# Altium project Main-Controller-Board-v1.2.0.PrjPcb
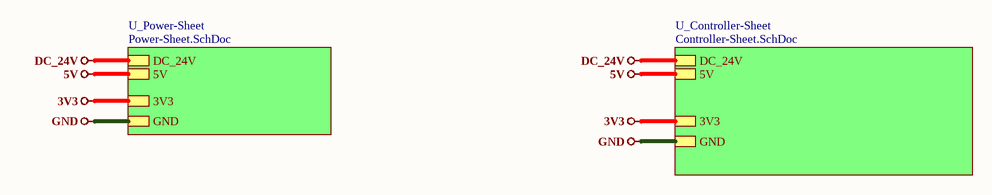
[diagram p0: Top_Sheet.SchDoc]
3 sheets, 70 parts. Net scope: hierarchical (ports join the sheet entries above them; power ports are global).
Board file: Main-Controller-Board-PCB.PcbDoc
Sheets:
  Top_Sheet.SchDoc
    U_Controller-Sheet = Controller-Sheet.SchDoc
    U_Power-Sheet = Power-Sheet.SchDoc

## Sheet Top_Sheet.SchDoc
size 420 x 297 mm; SheetNumber: 1; SheetTotal: 3

### Sub-sheets
U_Controller-Sheet = Controller-Sheet.SchDoc: 3V3, GND, 5V, DC_24V
U_Power-Sheet = Power-Sheet.SchDoc: 3V3, 5V, GND, DC_24V

### Nets
3V3: sheet U_Controller-Sheet/3V3, sheet U_Power-Sheet/3V3
5V: sheet U_Controller-Sheet/5V, sheet U_Power-Sheet/5V
DC_24V: sheet U_Controller-Sheet/DC_24V, sheet U_Power-Sheet/DC_24V
GND: sheet U_Controller-Sheet/GND, sheet U_Power-Sheet/GND

### Notes on the sheet
- File:
- Title:
- Date:
- Page
- Num:
- Total:
- Drawn By: Huzaifa Ali

## Sheet Controller-Sheet.SchDoc
size 420 x 297 mm; SheetNumber: 3; SheetTotal: 3
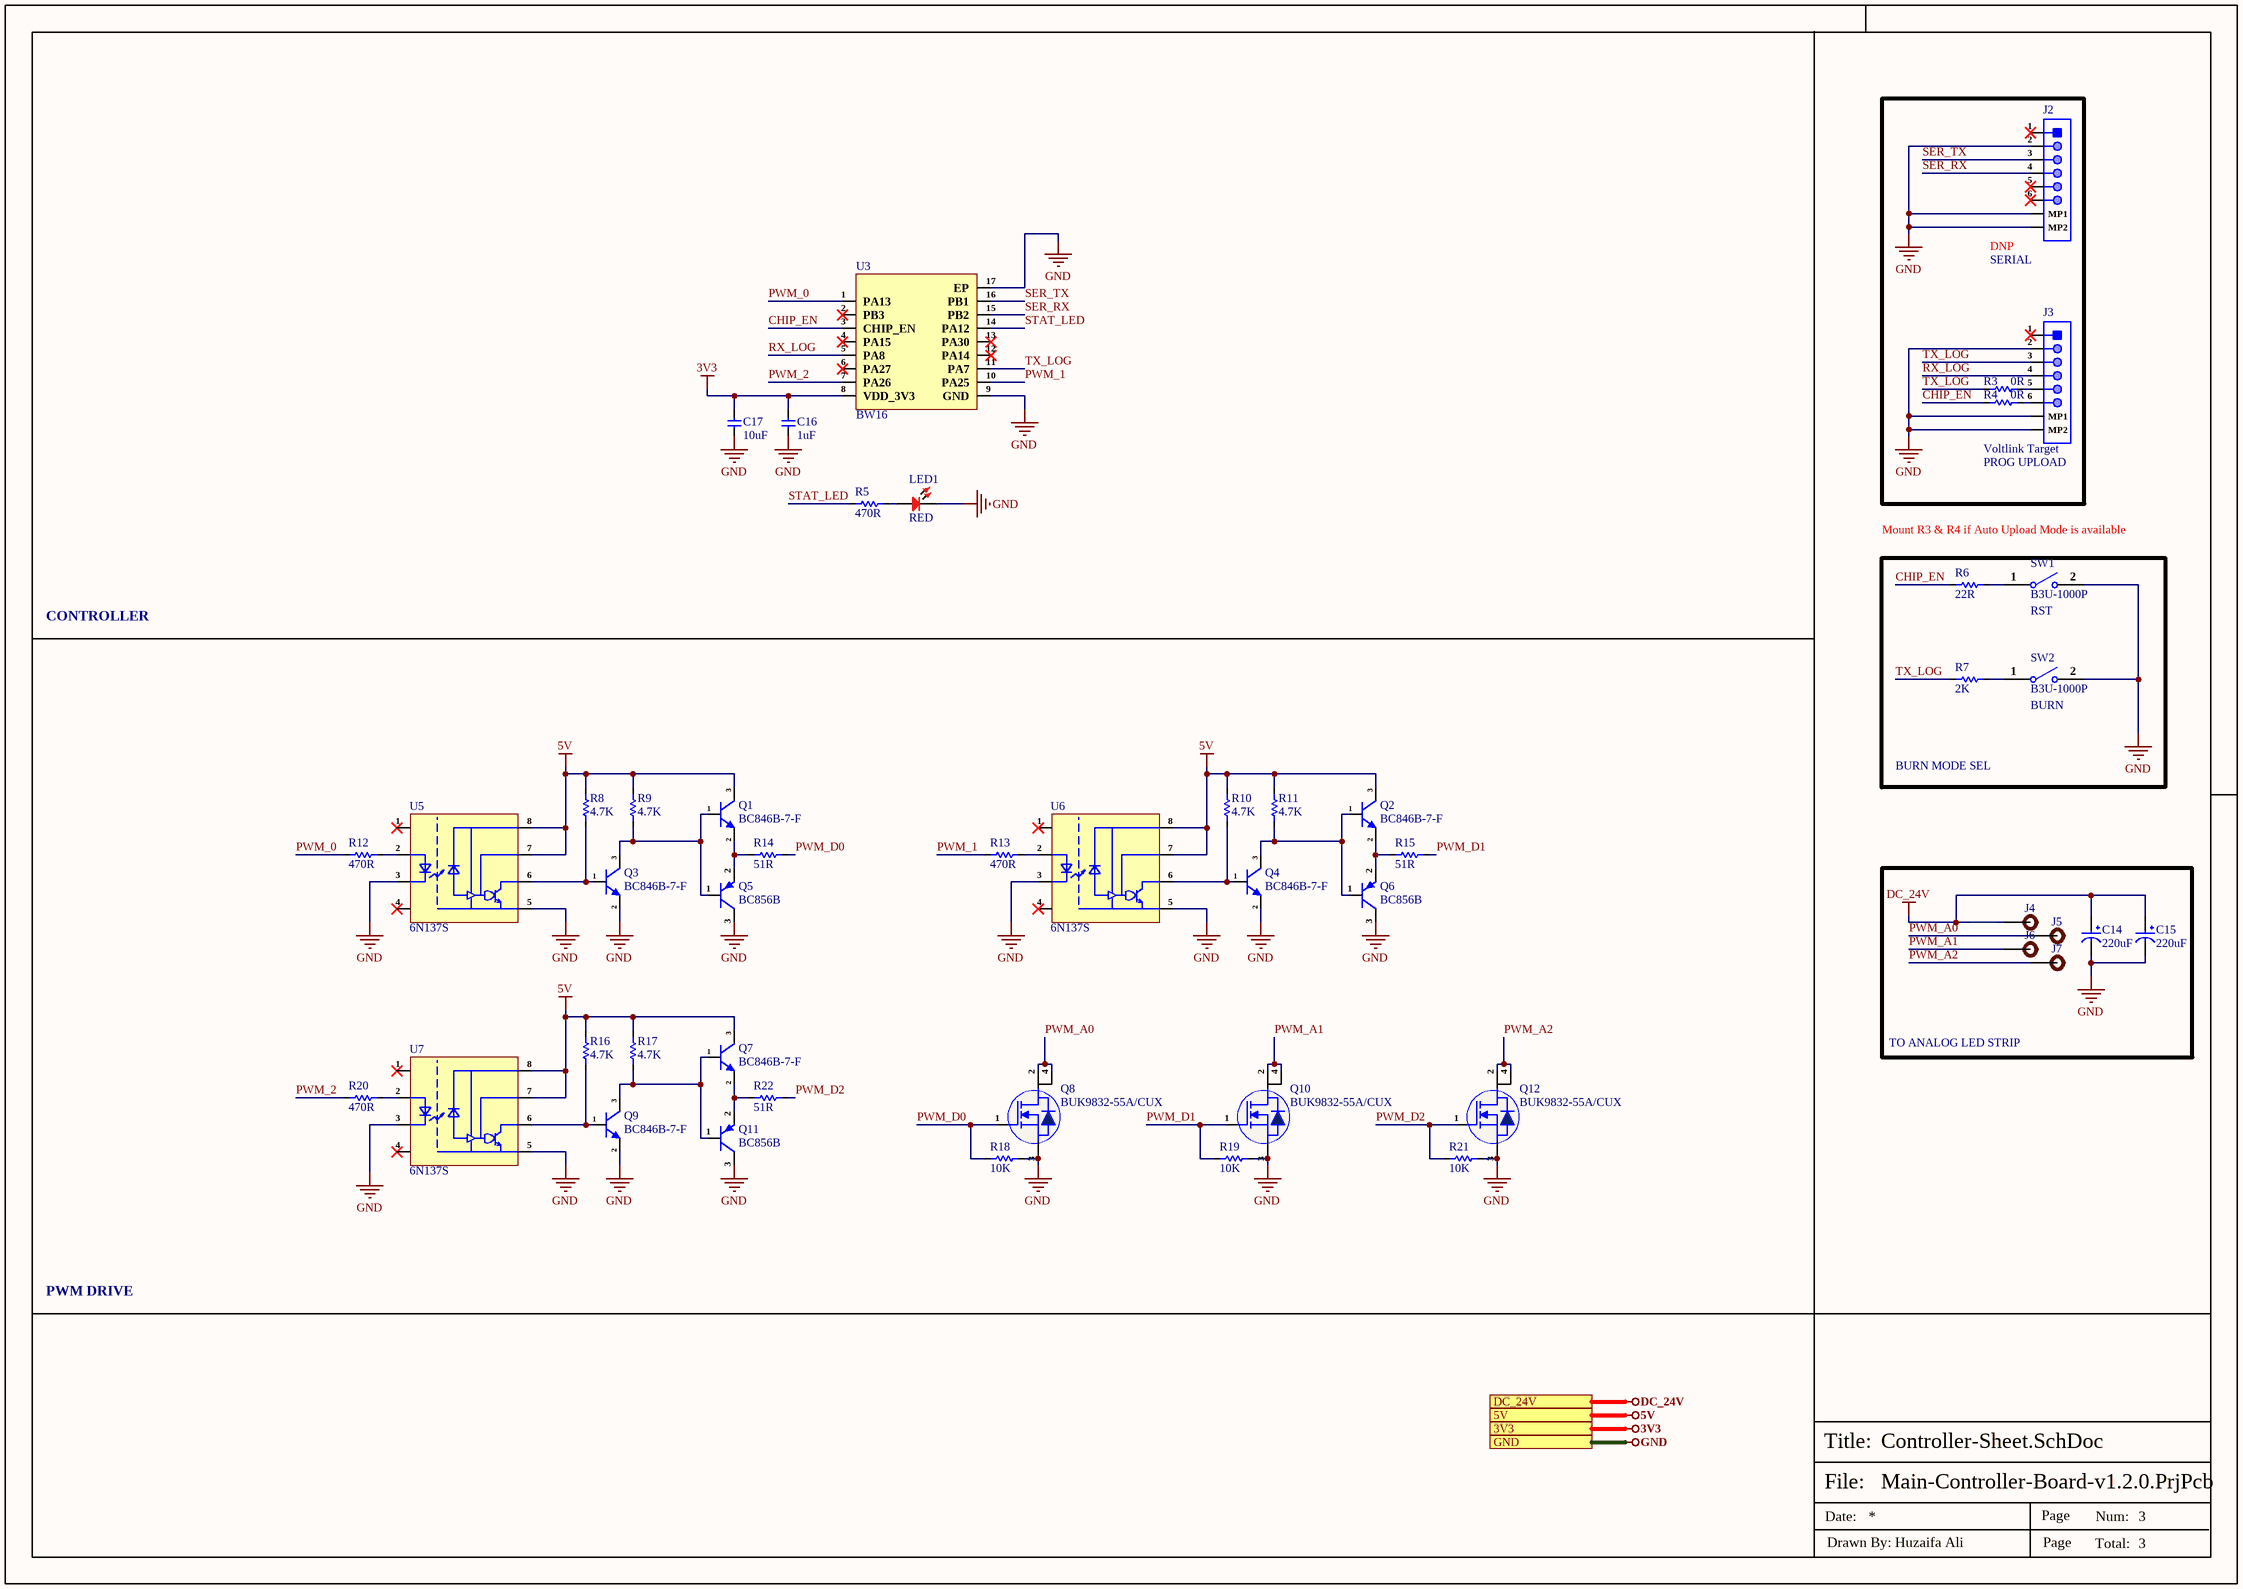
[diagram p1: Controller-Sheet.SchDoc]

### Parts
C14  220uF  [189RV0019]
C15  220uF  [189RV0019]
C16  1uF  [Cap-0402]
C17  10uF  [Cap-1210]
J2  DNP  [Voltlink Target]
J3  Voltlink Target  [Voltlink Target]
J4  Radius Pad  [Radius Pad]  (value not drawn)
J5  Radius Pad  [Radius Pad]  (value not drawn)
J6  Radius Pad  [Radius Pad]  (value not drawn)
J7  Radius Pad  [Radius Pad]  (value not drawn)
LED1  RED  [LED-0603]
Q1  BC846B-7-F  [SOT-23]
Q2  BC846B-7-F  [SOT-23]
Q3  BC846B-7-F  [SOT-23]
Q4  BC846B-7-F  [SOT-23]
Q5  BC856B  [SOT-23]
Q6  BC856B  [SOT-23]
Q7  BC846B-7-F  [SOT-23]
Q8  BUK9832-55A/CUX  [SOT- 223]
Q9  BC846B-7-F  [SOT-23]
Q10  BUK9832-55A/CUX  [SOT- 223]
Q11  BC856B  [SOT-23]
Q12  BUK9832-55A/CUX  [SOT- 223]
R3  0R  [Res-0402]
R4  0R  [Res-0402]
R5  470R  [Res-0603]
R6  22R  [Res-0402]
R7  2K  [Res-0402]
R8  4.7K  [Res-0402]
R9  4.7K  [Res-0402]
R10  4.7K  [Res-0402]
R11  4.7K  [Res-0402]
R12  470R  [Res-0603]
R13  470R  [Res-0603]
R14  51R  [RES-2512]
R15  51R  [RES-2512]
R16  4.7K  [Res-0402]
R17  4.7K  [Res-0402]
R18  10K  [Res-0402]
R19  10K  [Res-0402]
R20  470R  [Res-0603]
R21  10K  [Res-0402]
R22  51R  [RES-2512]
SW1  B3U-1000P  [B3U-1000P]
SW2  B3U-1000P  [B3U-1000P]
U3  BW16  [BW16]
U5  6N137S  [SOP-8 (S Type)]
U6  6N137S  [SOP-8 (S Type)]
U7  6N137S  [SOP-8 (S Type)]

### Blocks framed on the sheet
TO ANALOG LED STRIP: C14 C15 J4-J7

### Ports
3V3 (see Top_Sheet[4B], Power-Sheet[4D]), 5V (see Top_Sheet[4B], Power-Sheet[4D]), DC_24V (see Top_Sheet[4B], Power-Sheet[4D]), GND (see Top_Sheet[4B], Power-Sheet[4D])

### Nets
3V3: C16.2 C17.2 U3.8(VDD_3V3) ; port 3V3
5V: Q1.3(C) Q2.3(C) Q7.3(C) R8.2 R9.2 R10.2 R11.2 R16.2 R17.2 U5.7(VE) U5.8(VCC) U6.7(VE) U6.8(VCC) U7.7(VE) U7.8(VCC) ; port 5V
DC_24V: C14.1 C15.1 J4.1 ; port DC_24V
GND: C14.2 C15.2 C16.1 C17.1 J2.2 J2.MP1 J2.MP2 J3.2 J3.MP1 J3.MP2 LED1.2 Q3.2(E) Q4.2(E) Q5.3(C) Q6.3(C) Q8.3(S) Q9.2(E) Q10.3(S) Q11.3(C) Q12.3(S) R18.2 R19.2 R21.2 SW1.2 SW2.2 U3.9(GND) U3.17(EP) U5.3(C) U5.5(GND) U6.3(C) U6.5(GND) U7.3(C) U7.5(GND) ; port GND
CHIP_EN: R4.1 R6.1 U3.3(CHIP_EN)
PWM_0: R12.1 U3.1(PA13)
PWM_1: R13.1 U3.10(PA25)
PWM_2: R20.1 U3.7(PA26)
PWM_A0: J5.1 Q8.2(D) Q8.4(D)
PWM_A1: J6.1 Q10.2(D) Q10.4(D)
PWM_A2: J7.1 Q12.2(D) Q12.4(D)
PWM_D0: Q8.1(G) R14.2 R18.1
PWM_D1: Q10.1(G) R15.2 R19.1
PWM_D2: Q12.1(G) R21.1 R22.2
RX_LOG: J3.4 U3.5(PA8)
SER_RX: J2.4 U3.15(PB2)
SER_TX: J2.3 U3.16(PB1)
STAT_LED: R5.1 U3.14(PA12)
TX_LOG: J3.3 R3.1 R7.1 U3.11(PA7)
NetJ3_5: J3.5 R3.2
NetJ3_6: J3.6 R4.2
NetLED1_1: LED1.1 R5.2
NetQ1_1: Q1.1(B) Q3.3(C) Q5.1(B) R9.1
NetQ1_2: Q1.2(E) Q5.2(E) R14.1
NetQ2_1: Q2.1(B) Q4.3(C) Q6.1(B) R11.1
NetQ2_2: Q2.2(E) Q6.2(E) R15.1
NetQ3_1: Q3.1(B) R8.1 U5.6(VO)
NetQ4_1: Q4.1(B) R10.1 U6.6(VO)
NetQ7_1: Q7.1(B) Q9.3(C) Q11.1(B) R17.1
NetQ7_2: Q7.2(E) Q11.2(E) R22.1
NetQ9_1: Q9.1(B) R16.1 U7.6(VO)
NetR6_2: R6.2 SW1.1
NetR7_2: R7.2 SW2.1
NetR12_2: R12.2 U5.2(A)
NetR13_2: R13.2 U6.2(A)
NetR20_2: R20.2 U7.2(A)

Not connected (* = marked no-connect by the designer): J2 1* 5* 6*; J3 1*; U3 2(PB3)* 4(PA15)* 6(PA27)* 12(PA14)* 13(PA30)*; U5 1(NC)* 4(NC)*; U6 1(NC)* 4(NC)*; U7 1(NC)* 4(NC)*

### Notes on the sheet
- (near J2) SERIAL
- Mount R3 & R4 if Auto Upload Mode is available
- (near J3) PROG UPLOAD
- CONTROLLER
- (near SW1) RST
- (near SW2) BURN
- BURN MODE SEL
- PWM DRIVE
- File:
- Title:
- Date:
- Page
- Num:
- Total:
- Drawn By: Huzaifa Ali

### Library data of the parts
C14 C15 = 189RV0019: 220uF 35V 600mA@100KHz 160mΩ@100KHz ±20% SMD,D6.3xL7.7mm Aluminum Electrolytic Capacitors - SMD ROHS; Manufacturer: KNSCHA; Manufacturer Part Number: 189RV0019; Package: SMD,D6.3xL7.7mm; LCSC Part Number: C7471881; Item Type: Capacitors; ComponentLink1Description: LCSC; ComponentLink1URL: https://www.lcsc.com/product-detail/Aluminum-Electrolytic-Capacitors-SMD_KNSCHA-189RV0019_C7471881.html
C16 = CC0402KRX5R7BB105: CAP CER 1UF 16V X5R 0402; Manufacturer: Yageo; Tolerance: 10%; Item Type: Capacitor; Supplier 1: Digi-Key; Manufacturer Part Number: CC0402KRX5R7BB105; Stock 1: 1405667; Pricing 1: 1=0.36, 10=0.252, 100=0.1512, 500=0.1134, 1000=0.09576, 2500=0.09072, 5000=0.08568 (USD); Mount: Surface Mount; Case/Package: 0402; Weight: 2.3E-05oz; Case Code (Imperial): 0402; Case Code (Metric): 1005; Min Operating Temperature: -55°C; Max Operating Temperature: 85°C; Capacitance: 1uF; Dielectric: X5R; Packaging: Tape and Reel; Voltage Rating (DC): 16V; Voltage Rating: 16V; Termination: SMD/SMT; Composition: Ceramic; Length: 1mm; Height: 0.5mm; Width: 0.02inch; Thickness: 0.022inch; Depth: 0.5mm; Radiation Hardening: No; Lead Free: Lead Free; Halogen Free: Halogen Free; ComponentLink1URL: http://www.yageo.com/documents/recent/UPY-GPHC_X5R_4V-to-50V_12.pdf?src-supplier=Avnet+Europe; ComponentLink1Description: http://www.yageo.com/documents/recent/UPY-GPHC_X5R_4V-to-50V_12.pdf?src-supplier=Avnet+Europe; Supplier Part Number 1: 311-1691-6-ND; LCSC Part Number: C325464
C17 = C3225X7R1E106MTJ00N: CAP CER 10UF 25V X7R 1210; Manufacturer: TDK Corporation; Manufacturer Part Number: C3225X7R1E106M250AC; Item Type: Capacitors; Package: 1210; LCSC Part Number: C694198; ComponentLink1Description: LCSC; ComponentLink1URL: https://www.lcsc.com/product-detail/Multilayer-Ceramic-Capacitors-MLCC-SMD-SMT_TDK-C3225X7R1E106MTJ00N_C694198.html
J2 J3 = C145963: 1x6P SH 1 1mm 6 SMD,P=1mm Wire To Board / Wire To Wire Connector ROHS; Manufacturer: BOOMELE; Manufacturer Part Number: C145963; Package: SMD,P=1mm; LCSC Part Number: C145963; Item Type: Connector; ComponentLink1Description: LCSC; ComponentLink1URL: https://www.lcsc.com/product-detail/Wire-To-Board-Wire-To-Wire-Connector_BOOMELE-Boom-Precision-Elec-C145963_C145963.html
J4-J7 = Radius Pad: Wire Connecting pad; ComponentLink1Description: LCSC; ComponentLink1URL: *
LED1 = NCD0603R3: RED LED 0603 Light Emitting Diodes; Manufacturer: Foshan NationStar Optoelectronics; Manufacturer Part Number: NCD0603R3; Package: 0603; Item Type: LED; LCSC Part Number: C3151730; ComponentLink1Description: LCSC; ComponentLink1URL: https://www.lcsc.com/product-detail/Light-Emitting-Diodes-LED_Foshan-NationStar-Optoelectronics-NCD0603R3_C3151730.html
Q1-Q4 Q7 Q9 = BC846B-7-F: TRANS NPN 65V 0.1A SOT23-3; Manufacturer: Diodes; Item Type: Transistors; Supplier: Future Electronics; Supplier Part Number: 3888237; Manufacturer Part Number: BC846B-7-F; RoHS: Yes; Category: BJTs; Stock: 4416000; Pricing: 3000=0.0363, 12000=0.0348, 45000=0.0335, 120000=0.0325, 300000=0.0309 (USD); ComponentLink1URL: https://datasheet.ciiva.com/15139/getdatasheetpartid-139519-15139459.pdf?src-supplier=Verical; ComponentLink1Description: https://datasheet.ciiva.com/15139/getdatasheetpartid-139519-15139459.pdf?src-supplier=Verical; ComponentLink2URL: https://datasheet.ciiva.com/22711/1911717-22711685.pdf?src-supplier=Element14; ComponentLink2Description: https://datasheet.ciiva.com/22711/1911717-22711685.pdf?src-supplier=Element14; LCSC Part Number: C183643
Q5 Q6 Q11 = BC856B: 65V 200mW 220@2mA,5V 100mA PNP SOT-23 Bipolar Transistors - BJT ROHS; Manufacturer: Guangdong Hottech; Manufacturer Part Number: BC856B; Package: SOT-23; LCSC Part Number: C181144; Item Type: Transistors; ComponentLink1Description: LCSC; ComponentLink1URL: https://www.lcsc.com/product-detail/Bipolar-Transistors-BJT_Guangdong-Hottech-BC856B_C181144.html
Q8 Q10 Q12 = BUK9832-55A/CUX: MOSFET N-CH 55V 12A SOT223; Manufacturer: Nexperia; Item Type: MOSFETs; Input Capacitance: 1.594nF; Max Power Dissipation: 8W; Rds On Max: 29mR; Fall Time: 68ns; Gate to Source Voltage (Vgs): 10V; Rise Time: 125ns; Turn-Off Delay Time: 64ns; Turn-On Delay Time: 14ns; Supplier: Future Electronics; LCSC Part Number: C458151; Manufacturer Part Number: BUK9832-55A/CUX; RoHS: Yes; Stock: 59000; Pricing: 1000=0.305, 2000=0.295, 4000=0.29, 5000=0.29, 15000=0.275 (USD); Case/Package: 73Case; Pins: 4NUMBER; Contact Plating: 154ConductorMaterial; Min Operating Temperature: -55°C; Max Operating Temperature: 150°C; Packaging: 10Packaging; Continuous Drain Current (ID): 12A; Drain to Source Voltage (Vdss): 55V; Max Dual Supply Voltage: 55V; ComponentLink1URL: https://www.mouser.com/ds/2/302/BUK9832-55A-196161.pdf?src-supplier=Mouser; ComponentLink1Description: https://www.mouser.com/ds/2/302/BUK9832-55A-196161.pdf?src-supplier=Mouser; ComponentLink2URL: http://datasheet.octopart.com/BUK9832-55A-CUX-Nexperia-datasheet-87843131.pdf?src-supplier=Newark; ComponentLink2Description: http://datasheet.octopart.com/BUK9832-55A-CUX-Nexperia-datasheet-87843131.pdf?src-supplier=Newark; ComponentLink3URL: http://datasheet.octopart.com/BUK9832-55A-CUX-Nexperia-datasheet-87843131.pdf?src-supplier=Avnet; ComponentLink3Description: http://datasheet.octopart.com/BUK9832-55A-CUX-Nexperia-datasheet-87843131.pdf?src-supplier=Avnet; ComponentLink4URL: http://datasheet.octopart.com/BUK9832-55A-CUX-Nexperia-datasheet-87843131.pdf?src-supplier=Farnell; ComponentLink4Description: http://datasheet.octopart.com/BUK9832-55A-CUX-Nexperia-datasheet-87843131.pdf?src-supplier=Farnell; ComponentLink5URL: http://datasheet.octopart.com/BUK9832-55A-CUX-Nexperia-datasheet-87843131.pdf?src-supplier=Digikey; ComponentLink5Description: http://datasheet.octopart.com/BUK9832-55A-CUX-Nexperia-datasheet-87843131.pdf?src-supplier=Digikey; ComponentLink6URL: https://assets.nexperia.com/documents/data-sheet/BUK9832-55A.pdf?src-supplier=Digikey; ComponentLink6Description: https://assets.nexperia.com/documents/data-sheet/BUK9832-55A.pdf?src-supplier=Digikey; ComponentLink7URL: https://datasheet.octopart.com/BUK9832-55A-CUX-Nexperia-datasheet-87843131.pdf?src-supplier=Future+Electronics; ComponentLink7Description: https://datasheet.octopart.com/BUK9832-55A-CUX-Nexperia-datasheet-87843131.pdf?src-supplier=Future+Electronics; ComponentLink8URL: http://datasheet.octopart.com/BUK9832-55A-CUX-Nexperia-datasheet-87843131.pdf?src-supplier=TME; ComponentLink8Description: http://datasheet.octopart.com/BUK9832-55A-CUX-Nexperia-datasheet-87843131.pdf?src-supplier=TME; ComponentLink9URL: http://datasheet.octopart.com/BUK9832-55A-CUX-Nexperia-datasheet-87843131.pdf?src-supplier=Quest; ComponentLink9Description: http://datasheet.octopart.com/BUK9832-55A-CUX-Nexperia-datasheet-87843131.pdf?src-supplier=Quest; ComponentLink10URL: http://datasheet.octopart.com/BUK9832-55A-CUX-Nexperia-datasheet-87843131.pdf?src-supplier=TTI; ComponentLink10Description: http://datasheet.octopart.com/BUK9832-55A-CUX-Nexperia-datasheet-87843131.pdf?src-supplier=TTI
R3 R4 = RC0402FR-070RL: RES 0 OHM JUMPER 1/16W 0402; Manufacturer: Yageo; Item Type: Resistors; Tolerance: 1%; Power Rating: 62.5mW; Voltage Rating: 50V; Temperature Coefficient: 200ppm/°C; Max Power Dissipation: 63mW; Supplier 1: Mouser; Manufacturer Part Number: RC0402FR-070RL; RoHS: Yes; Stock 1: 8556842; Pricing 1: 1=0.10000, 10=0.01400, 50=0.01400, 100=0.00600, 1000=0.00300, 5000=0.00200, 10000=0.00100 (USD); Mount: Surface Mount; Case/Package: 0402; Contact Plating: Tin,Matte; Case Code (Imperial): 0402; Case Code (Metric): 1005; Size Code: 0402; Min Operating Temperature: -55°C; Max Operating Temperature: 155°C; Resistance: 0R; Resistor Type: Thick Film; Packaging: Tape and Reel; Termination: SMD/SMT; Features: Moisture Resistant; Series: RC; Number of Terminations: 2; Length: 1mm; Width: 0.5mm; Height: 0.35mm; Radiation Hardening: No; Lead Free: Lead Free; RoHS Compliant: Yes; ComponentLink1URL: https://datasheet.ciiva.com/8896/pyu-rc0402-51-rohs-l-6-8896149.pdf?src-supplier=Avnet; ComponentLink1Description: https://datasheet.ciiva.com/8896/pyu-rc0402-51-rohs-l-6-8896149.pdf?src-supplier=Avnet; ComponentLink2URL: https://datasheet.ciiva.com/16790/pyu-rc0402-51-rohs-l-6-r-16790444.pdf?src-supplier=Future+Electronics; ComponentLink2Description: https://datasheet.ciiva.com/16790/pyu-rc0402-51-rohs-l-6-r-16790444.pdf?src-supplier=Future+Electronics; Supplier Part Number 1: 603-RC0402FR-070RL; LCSC Part Number: C106231
R5 R12 R13 R20 = RC0603FR-07470RL: RES 470 OHM 1% 1/10W 0603; Manufacturer: Yageo; Power Rating: 100mW; Voltage Rating: 50V; Temperature Coefficient: 100ppm/°C; Working Voltage: 75V; Supplier 1: Digi-Key; Manufacturer Part Number: RC0603FR-07470RL; RoHS: Yes; Category: Chip SMD Resistors; Stock 1: 154083; Pricing 1: 1=0.10000, 10=0.02400, 100=0.00970, 1000=0.00436, 2500=0.00378 (USD); Case/Package: 0603; Case Code (Metric): 1608; Case Code (Imperial): 0603; Min Operating Temperature: -55°C; Max Operating Temperature: 155°C; Tolerance: 1%; Resistance: 470R; Packaging: Tape and Reel; Package Quantity: 1; Resistor Type: Thick Film; Number of Terminations: 2; Termination: SMD/SMT; Max Power Dissipation: 100mW; Features: Moisture Resistant; Series: RC; Technology: THICK FILM; Resistance Tolerance: 1%; Construction: Rectangular; Length: 1.6mm; Width: 0.031inch; Height: 0.022inch; Depth: 0.8mm; RoHS Compliant: Yes; REACH SVHC: No SVHC; Military Standard: Not; Lead Free: Lead Free; ComponentLink1URL: https://datasheet.ciiva.com/11808/0900766b80f96399-11808177.pdf?src-supplier=RSComponents; ComponentLink1Description: https://datasheet.ciiva.com/11808/0900766b80f96399-11808177.pdf?src-supplier=RSComponents; ComponentLink2URL: https://datasheet.ciiva.com/7746/1738695-7746359.pdf?src-supplier=Element14; ComponentLink2Description: https://datasheet.ciiva.com/7746/1738695-7746359.pdf?src-supplier=Element14; ComponentLink3URL: https://datasheet.ciiva.com/7746/1738695-7746360.pdf?src-supplier=Element14; ComponentLink3Description: https://datasheet.ciiva.com/7746/1738695-7746360.pdf?src-supplier=Element14; ComponentLink4URL: https://datasheet.ciiva.com/7660/1868787-7660793.pdf?src-supplier=Element14; ComponentLink4Description: https://datasheet.ciiva.com/7660/1868787-7660793.pdf?src-supplier=Element14; ComponentLink5URL: https://datasheet.ciiva.com/46440/1868787-46440907.pdf?src-supplier=Element14; ComponentLink5Description: https://datasheet.ciiva.com/46440/1868787-46440907.pdf?src-supplier=Element14; ComponentLink6URL: https://datasheet.ciiva.com/2454/pyu-r-int-thick-7-2454012.pdf?src-supplier=Digi-Key; ComponentLink6Description: https://datasheet.ciiva.com/2454/pyu-r-int-thick-7-2454012.pdf?src-supplier=Digi-Key; ComponentLink7URL: https://datasheet.ciiva.com/2454/pyu-r-int-thick-7-2454013.pdf?src-supplier=Digi-Key; ComponentLink7Description: https://datasheet.ciiva.com/2454/pyu-r-int-thick-7-2454013.pdf?src-supplier=Digi-Key; ComponentLink8URL: https://datasheet.ciiva.com/2454/pyu-r-int-thick-7-2454014.pdf?src-supplier=Digi-Key; ComponentLink8Description: https://datasheet.ciiva.com/2454/pyu-r-int-thick-7-2454014.pdf?src-supplier=Digi-Key; Supplier Part Number 1: 311-470HRCT-ND; LCSC Part Number: C114669
R6 = RC0402FR-0722RL: RES 22 OHM 1% 1/16W 0402; Manufacturer: Yageo; Voltage Rating: 50V; Power Rating: 62.5mW; Temperature Coefficient: 100ppm/°C; Max Power Dissipation: 63mW; Item Type: Resistor; Supplier 1: Avnet; Manufacturer Part Number: RC0402FR-0722RL; RoHS: Yes; Category: Chip SMD Resistors; Stock 1: 1810000; Pricing 1: 10000=0.00085 (USD); Case/Package: 0402; Number of Pins: 2; Case Code (Imperial): 0402; Case Code (Metric): 1005; Size Code: 0402; Min Operating Temperature: -55°C; Max Operating Temperature: 155°C; Resistor Type: Thick Film; Voltage Rating (DC): 50V; Resistance: 22R; Tolerance: 1%; Packaging: Tape and Reel; Termination: SMD/SMT; Features: Moisture Resistant; Series: RC; Number of Terminations: 2; Resistance Tolerance: 1%; Technology: THICK FILM; Construction: Rectangular; Length: 1mm; Width: 0.5mm; Height: 0.32mm; Depth: 0.5mm; RoHS Compliant: Yes; Reach SVHC Compliant: Yes; Military Standard: Not; Lead Free: Lead Free; ComponentLink1URL: https://datasheet.ciiva.com/11819/0900766b80c66297-11819462.pdf?src-supplier=RSComponents; ComponentLink1Description: https://datasheet.ciiva.com/11819/0900766b80c66297-11819462.pdf?src-supplier=RSComponents; ComponentLink2URL: https://datasheet.ciiva.com/7849/1018594-7849912.pdf?src-supplier=Element14; ComponentLink2Description: https://datasheet.ciiva.com/7849/1018594-7849912.pdf?src-supplier=Element14; ComponentLink3URL: https://datasheet.ciiva.com/7849/1018594-7849911.pdf?src-supplier=Element14; ComponentLink3Description: https://datasheet.ciiva.com/7849/1018594-7849911.pdf?src-supplier=Element14; ComponentLink4URL: https://datasheet.ciiva.com/16930/pyu-rc0402-51-rohs-l-6-r-16930687.pdf?src-supplier=Future+Electronics; ComponentLink4Description: https://datasheet.ciiva.com/16930/pyu-rc0402-51-rohs-l-6-r-16930687.pdf?src-supplier=Future+Electronics; ComponentLink5URL: https://datasheet.ciiva.com/26829/getdatasheetpartid-554995-26829991.pdf?src-supplier=Verical; ComponentLink5Description: https://datasheet.ciiva.com/26829/getdatasheetpartid-554995-26829991.pdf?src-supplier=Verical; Supplier Part Number 1: RC0402FR-0722RL; LCSC Part Number: C114765
R7 = RC0402FR-072KL: RES 2K OHM 1% 1/16W 0402; Manufacturer: Yageo; Item Type: Resistor; Value: 2kR; Power Rating: 63mW; Voltage Rating: 50V; Temperature Coefficient: 100ppm/°C; LCSC Part Number: C60488; ComponentLink2URL: https://datasheet.ciiva.com/11808/0900766b80c66297-11808787.pdf?src-supplier=Rs; ComponentLink2Description: https://datasheet.ciiva.com/11808/0900766b80c66297-11808787.pdf?src-supplier=Rs; ComponentLink3URL: https://datasheet.ciiva.com/7849/1018594-7849934.pdf?src-supplier=Element14; ComponentLink3Description: https://datasheet.ciiva.com/7849/1018594-7849934.pdf?src-supplier=Element14; ComponentLink4URL: https://datasheet.ciiva.com/7849/1018594-7849935.pdf?src-supplier=Element14; ComponentLink4Description: https://datasheet.ciiva.com/7849/1018594-7849935.pdf?src-supplier=Element14; ComponentLink5URL: https://datasheet.ciiva.com/7983/1018594-7983517.pdf?src-supplier=Element14; ComponentLink5Description: https://datasheet.ciiva.com/7983/1018594-7983517.pdf?src-supplier=Element14; ComponentLink6URL: https://datasheet.ciiva.com/2453/pyu-r-int-thick-7-2453635.pdf?src-supplier=Digi-Key; ComponentLink6Description: https://datasheet.ciiva.com/2453/pyu-r-int-thick-7-2453635.pdf?src-supplier=Digi-Key; ComponentLink7URL: https://datasheet.ciiva.com/2453/pyu-r-int-thick-7-2453636.pdf?src-supplier=Digi-Key; ComponentLink7Description: https://datasheet.ciiva.com/2453/pyu-r-int-thick-7-2453636.pdf?src-supplier=Digi-Key; ComponentLink8URL: https://datasheet.ciiva.com/2453/pyu-r-int-thick-7-2453634.pdf?src-supplier=Digi-Key; ComponentLink8Description: https://datasheet.ciiva.com/2453/pyu-r-int-thick-7-2453634.pdf?src-supplier=Digi-Key; ComponentLink9URL: https://datasheet.ciiva.com/12667/pyu-rc0402-51-rohs-l-6-r-12667451.pdf?src-supplier=Mouser; ComponentLink9Description: https://datasheet.ciiva.com/12667/pyu-rc0402-51-rohs-l-6-r-12667451.pdf?src-supplier=Mouser; ComponentLink10URL: https://datasheet.ciiva.com/15189/getdatasheetpartid-358921-15189414.pdf?src-supplier=Verical; ComponentLink10Description: https://datasheet.ciiva.com/15189/getdatasheetpartid-358921-15189414.pdf?src-supplier=Verical; Supplier: Future Electronics; Supplier Part Number: 7970452; Manufacturer Part Number: RC0402FR-072KL; RoHS: Yes; Category: Chip SMD Resistors; Stock: 8530000; Pricing: 10000=0.0018, 100000=0.0011, 200000=0.0017, 300000=0.001, 750000=0.0016, 2000000=0.0009, 2500000=0.0016, 10000000=0.0014 (USD); Case/Package: 0402; Case Code (Metric): 1005; Case Code (Imperial): 0402; Min Operating Temperature: -55°C; Max Operating Temperature: 155°C; Resistor Type: Thick Film; Tolerance: 1%; Package Quantity: 1; Packaging: Tape and Reel; Number of Terminations: 2; Termination: SMD/SMT; Max Power Dissipation: 63mW; Working Voltage: 50V; Features: Moisture Resistant; Series: RC; Technology: THICK FILM; Construction: Rectangular; Resistance Tolerance: 1%; Voltage Rating (DC): 50V; Length: 0.039inch; Width: 0.02inch; Height: 0.016inch; Depth: 0.5mm; RoHS Compliant: Yes; Military Standard: Not; Reach SVHC Compliant: Unknown; Lead Free: 5697LeadFree; ComponentLink1URL: https://datasheet.ciiva.com/11808/0900766b80c66297-11808787.pdf?src-supplier=Rs; ComponentLink1Description: https://datasheet.ciiva.com/11808/0900766b80c66297-11808787.pdf?src-supplier=Rs; ComponentLink11URL: https://datasheet.ciiva.com/2453/pyu-r-int-thick-7-2453635.pdf?src-supplier=Digikey; ComponentLink11Description: https://datasheet.ciiva.com/2453/pyu-r-int-thick-7-2453635.pdf?src-supplier=Digikey; ComponentLink12URL: https://datasheet.ciiva.com/2453/pyu-r-int-thick-7-2453636.pdf?src-supplier=Digikey; ComponentLink12Description: https://datasheet.ciiva.com/2453/pyu-r-int-thick-7-2453636.pdf?src-supplier=Digikey; ComponentLink13URL: https://datasheet.ciiva.com/2453/pyu-r-int-thick-7-2453634.pdf?src-supplier=Digikey; ComponentLink13Description: https://datasheet.ciiva.com/2453/pyu-r-int-thick-7-2453634.pdf?src-supplier=Digikey
R8-R11 R16 R17 = RC0402FR-074K7L: RES 4.7K OHM 1% 1/16W 0402; Manufacturer: Yageo; Voltage Rating (DC): 50V; Power Rating: 62.5mW; Resistance: 4.7kR; Temperature Coefficient: 100ppm/°C; Max Power Dissipation: 63mW; Item Type: Resistor; Supplier 1: Avnet; Manufacturer Part Number: RC0402FR-074K7L; RoHS: Yes; Category: Chip SMD Resistors; Stock 1: 2420000; Pricing 1: 10000=0.00085 (USD); Case/Package: 0402; Number of Pins: 2; Case Code (Imperial): 0402; Case Code (Metric): 1005; Size Code: 0402; Min Operating Temperature: -55°C; Max Operating Temperature: 155°C; Tolerance: 1%; Voltage Rating: 50V; Packaging: Tape and Reel; Resistor Type: Thick Film; Termination: SMD/SMT; Features: Moisture Resistant; Series: RC; Number of Terminations: 2; Resistance Tolerance: 1%; Construction: Rectangular; Length: 1mm; Width: 0.5mm; Height: 0.32mm; Depth: 0.5mm; Height - Seated (Max): 0.016inch; RoHS Compliant: Yes; Reach SVHC Compliant: Yes; Military Standard: Not; Lead Free: Lead Free; ComponentLink1URL: https://datasheet.ciiva.com/22661/1686128-22661342.pdf?src-supplier=Element14; ComponentLink1Description: https://datasheet.ciiva.com/22661/1686128-22661342.pdf?src-supplier=Element14; ComponentLink2URL: https://datasheet.ciiva.com/7850/1018594-7850022.pdf?src-supplier=Element14; ComponentLink2Description: https://datasheet.ciiva.com/7850/1018594-7850022.pdf?src-supplier=Element14; ComponentLink3URL: https://datasheet.ciiva.com/7850/1018594-7850023.pdf?src-supplier=Element14; ComponentLink3Description: https://datasheet.ciiva.com/7850/1018594-7850023.pdf?src-supplier=Element14; ComponentLink4URL: https://datasheet.ciiva.com/15215/getdatasheetpartid-328119-15215035.pdf?src-supplier=Verical; ComponentLink4Description: https://datasheet.ciiva.com/15215/getdatasheetpartid-328119-15215035.pdf?src-supplier=Verical; Supplier Part Number 1: RC0402FR-074K7L; LCSC Part Number: C105871
R14 R15 R22 = FRC2512F51R0TS: 1W Thick Film Resistors 200V ±100ppm/℃ ±1% 51Ω 2512 Chip Resistor - Surface Mount ROHS; Manufacturer: FOJAN; Manufacturer Part Number: FRC2512F51R0TS; Package: 2512; LCSC Part Number: C2934078; Item Type: Resistor; ComponentLink1Description: LCSC; ComponentLink1URL: https://www.lcsc.com/product-detail/Chip-Resistor-Surface-Mount_FOJAN-FRC2512F51R0TS_C2934078.html
R18 R19 R21 = RC0402FR-0710KL: RES 10K OHM 1% 1/16W 0402; Manufacturer: Yageo; Resistance: 10kR; Voltage Rating (DC): 50V; Temperature Coefficient: 100ppm/°C; Power Rating: 62.5mW; Max Power Dissipation: 63mW; Item Type: Resistor; Supplier 1: Mouser; Manufacturer Part Number: RC0402FR-0710KL; RoHS: Yes; Category: Chip SMD Resistors; Stock 1: 18648329; Pricing 1: 1=0.10000, 10=0.01400, 50=0.01400, 100=0.00500, 1000=0.00300, 10000=0.00200 (USD); Case/Package: 0402; Number of Pins: 2; Case Code (Imperial): 0402; Case Code (Metric): 1005; Min Operating Temperature: -55°C; Max Operating Temperature: 155°C; Resistor Type: Thick Film; Tolerance: 1%; Packaging: Tape and Reel; Voltage Rating: 50V; Termination: SMD/SMT; Working Voltage: 50V; Number of Terminations: 2; Features: Moisture Resistant; Series: RC; Resistance Tolerance: 1%; Construction: Rectangular; Length: 1mm; Width: 0.5mm; Height: 0.32mm; Depth: 0.5mm; Lead Pitch: 0.2mm; REACH SVHC: No SVHC; Lead Free: Lead Free; RoHS Compliant: Yes; Military Standard: Not; ComponentLink1URL: https://datasheet.ciiva.com/7660/38568-7660787.pdf?src-supplier=Element14; ComponentLink1Description: https://datasheet.ciiva.com/7660/38568-7660787.pdf?src-supplier=Element14; ComponentLink2URL: https://datasheet.ciiva.com/7849/1686128-7849814.pdf?src-supplier=Element14; ComponentLink2Description: https://datasheet.ciiva.com/7849/1686128-7849814.pdf?src-supplier=Element14; ComponentLink3URL: https://datasheet.ciiva.com/7983/1018594-7983486.pdf?src-supplier=Element14; ComponentLink3Description: https://datasheet.ciiva.com/7983/1018594-7983486.pdf?src-supplier=Element14; ComponentLink4URL: https://datasheet.ciiva.com/22747/1018594-22747512.pdf?src-supplier=Element14; ComponentLink4Description: https://datasheet.ciiva.com/22747/1018594-22747512.pdf?src-supplier=Element14; ComponentLink5URL: https://datasheet.ciiva.com/12667/pyu-rc0402-51-rohs-l-6-r-12667067.pdf?src-supplier=Mouser; ComponentLink5Description: https://datasheet.ciiva.com/12667/pyu-rc0402-51-rohs-l-6-r-12667067.pdf?src-supplier=Mouser; ComponentLink6URL: https://datasheet.ciiva.com/7849/1784430-7849813.pdf?src-supplier=Element14; ComponentLink6Description: https://datasheet.ciiva.com/7849/1784430-7849813.pdf?src-supplier=Element14; ComponentLink7URL: https://datasheet.ciiva.com/7849/1784430-7849815.pdf?src-supplier=Element14; ComponentLink7Description: https://datasheet.ciiva.com/7849/1784430-7849815.pdf?src-supplier=Element14; Supplier Part Number 1: 603-RC0402FR-0710KL; LCSC Part Number: C60490
SW1 SW2 = B3U-1000P: SWITCH TACTILE SPST-NO 0.05A 12V; Manufacturer: Omron; Mechanical Life: 200000Cycles; Operating Force: 1.5N; Throw Configuration: SPST; Current Rating: 50mA; Contact Resistance: 100mR; Illumination Type: Non-Illuminated,Illuminated; Switch Travel: 0.15mm; Switch Function: Off-Mom; Actuator Type: Standard; Actuator Length: 0.4mm; Ratings: Dust Proof,IP40; ComponentLink1URL: http://www.farnell.com/datasheets/60838.pdf?src-supplier=Farnell; ComponentLink1Description: http://www.farnell.com/datasheets/60838.pdf?src-supplier=Farnell; ComponentLink2URL: http://www.farnell.com/datasheets/60838.pdf?src-supplier=Element14; ComponentLink2Description: http://www.farnell.com/datasheets/60838.pdf?src-supplier=Element14; ComponentLink3URL: https://omronfs.omron.com/en_US/ecb/products/pdf/en-b3u.pdf?src-supplier=Digi-Key; ComponentLink3Description: https://omronfs.omron.com/en_US/ecb/products/pdf/en-b3u.pdf?src-supplier=Digi-Key; ComponentLink4URL: http://www.omron.com/ecb/products/pdf/en-b3u.pdf?src-supplier=Digi-Key; ComponentLink4Description: http://www.omron.com/ecb/products/pdf/en-b3u.pdf?src-supplier=Digi-Key; ComponentLink5URL: https://www.distrelec.biz/Web/Downloads/he/et/B3U_eng_datasheet.pdf?mime=application%2Fpdf&src-supplier=Distrelec; ComponentLink5Description: https://www.distrelec.biz/Web/Downloads/he/et/B3U_eng_datasheet.pdf?mime=application%2Fpdf&src-supplier=Distrelec; ComponentLink6URL: http://www.onlinecomponents.com/productFiles/mf-OM/en-b3u.pdf?src-supplier=Onlinecomponents.com; ComponentLink6Description: http://www.onlinecomponents.com/productFiles/mf-OM/en-b3u.pdf?src-supplier=Onlinecomponents.com; Supplier 1: Digi-Key; Manufacturer Part Number: B3U-1000P; Stock 1: 116454; Pricing 1: 1=1, 10=0.961, 25=0.9064, 50=0.7976, 100=0.7251, 250=0.68888, 500=0.67074, 1000=0.52571 (USD); Mount: Surface Mount; Weight: 0.000776oz; Contact Material: Silver; Min Operating Temperature: -25°C; Max Operating Temperature: 70°C; Packaging: Tape and Reel; Voltage Rating (DC): 12V; Package Quantity: 1; Max Current Rating: 50mA; Termination: SMD/SMT; Orientation: Straight; Max Voltage Rating (DC): 12V; Electrical Life: 200000Cycles; Insulation Resistance: 100MR; Contact Current Rating: 50mA; Length: 4mm; Height: 1.2mm; Depth: 2.5mm; Width: 3mm; REACH SVHC: Unknown; Lead Free: Lead Free; ComponentLink7URL: https://www.verical.com/server-webapp/html/getDatasheet?partID=552554&src-supplier=Verical; ComponentLink7Description: https://www.verical.com/server-webapp/html/getDatasheet?partID=552554&src-supplier=Verical; ComponentLink8URL: http://www.farnell.com/datasheets/1685550.pdf?src-supplier=Element14; ComponentLink8Description: http://www.farnell.com/datasheets/1685550.pdf?src-supplier=Element14; ComponentLink9URL: http://www.farnell.com/datasheets/2610940.pdf?src-supplier=Farnell; ComponentLink9Description: http://www.farnell.com/datasheets/2610940.pdf?src-supplier=Farnell; ComponentLink10URL: https://www.alliedelec.com/m/d/4c8a9ef82804fc3c241a13c1e298fd73.pdf?src-supplier=Allied+Electronics; ComponentLink10Description: https://www.alliedelec.com/m/d/4c8a9ef82804fc3c241a13c1e298fd73.pdf?src-supplier=Allied+Electronics; Supplier Part Number 1: SW1020DKR-ND; LCSC Part Number: C231329; Item Type: Switch
U3 = BW16: -90dBm 16dBm RTL8720DN Chip On-Board PCB Antenna 2.4GHz SMD,16x24mm WiFi Modules ROHS; Manufacturer: Ai-Thinker; Manufacturer Part Number: BW16; Package: SMD,16x24mm; LCSC Part Number: C2764067; Item Type: WiFi Module; ComponentLink1Description: LCSC; ComponentLink1URL: https://www.lcsc.com/product-detail/WiFi-Modules_Ai-Thinker-BW16_C2764067.html
U5-U7 = 6N137S: SOP-8 Logic Output Optoisolators ROHS; Manufacturer: UMW; Manufacturer Part Number: 6N137S; Package: SOP-8; LCSC Part Number: C5123515; Item Type: Optoisolators; ComponentLink1Description: LCSC; ComponentLink1URL: https://www.lcsc.com/product-detail/Logic-Output-Optoisolators_UMW-Youtai-Semiconductor-Co-Ltd-6N137S_C5123515.html

## Sheet Power-Sheet.SchDoc
size 420 x 297 mm; SheetNumber: 2; SheetTotal: 3
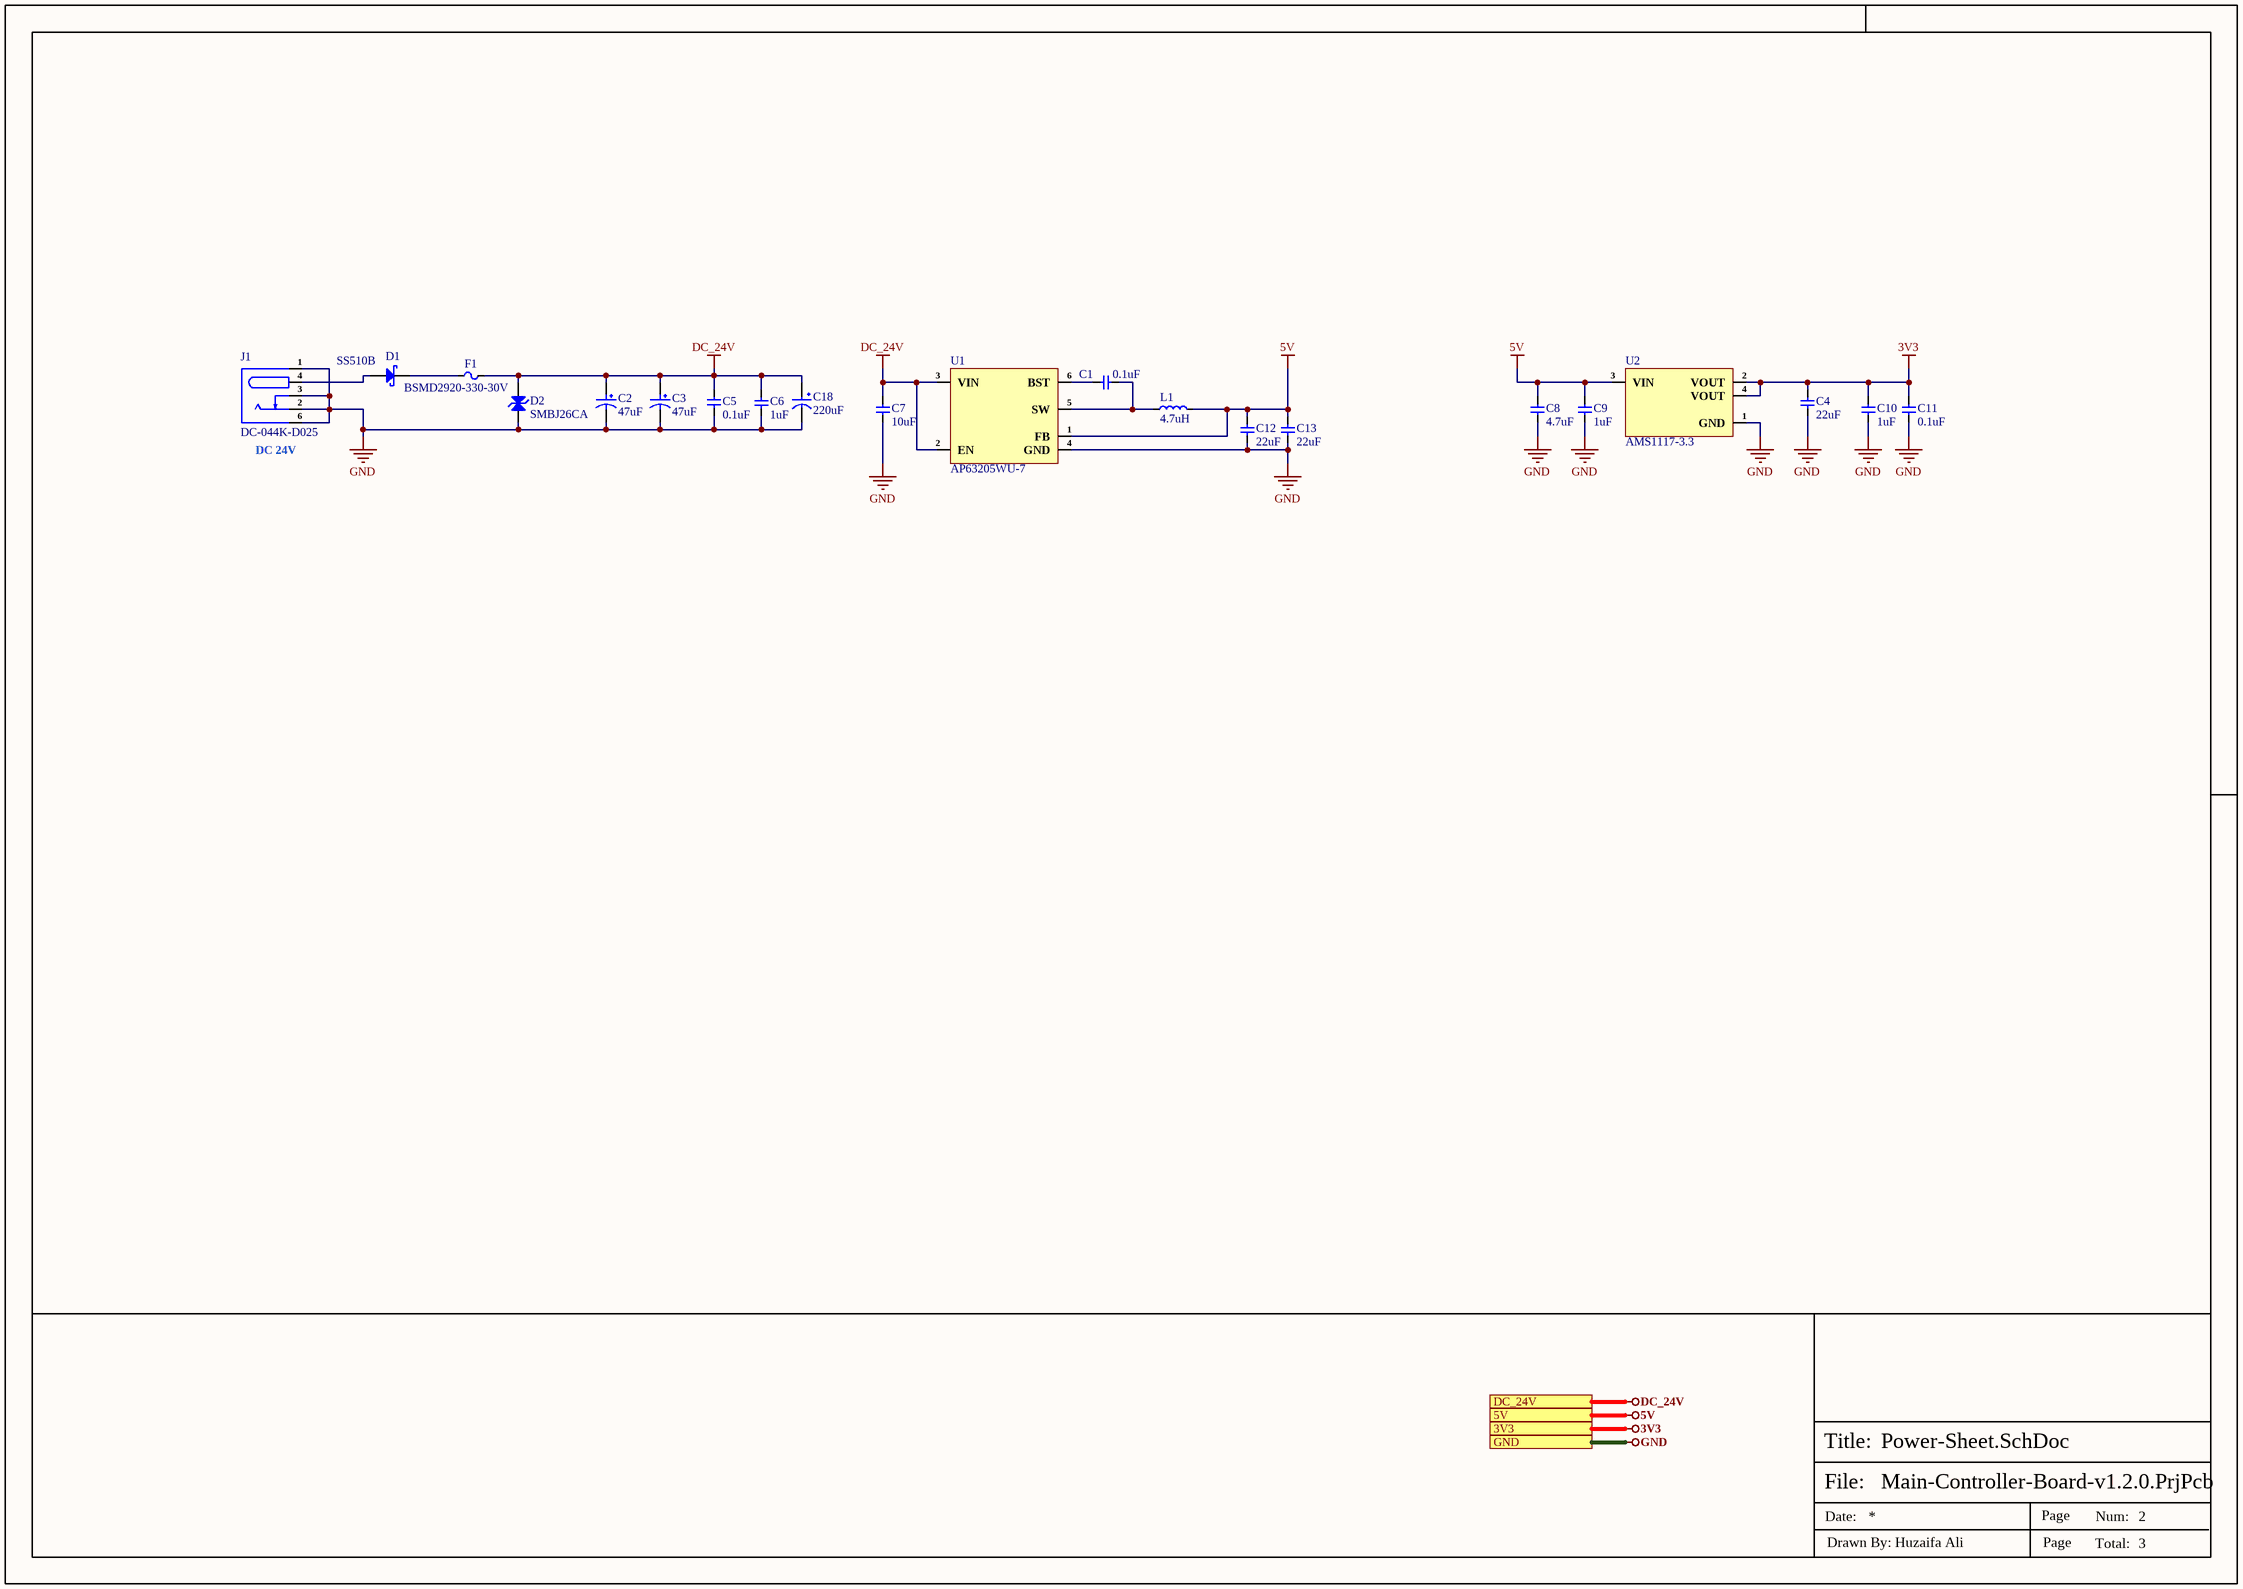
[diagram p2: Power-Sheet.SchDoc]

### Parts
C1  0.1uF  [Cap-0402]
C2  47uF  [RVT1H470M0607]
C3  47uF  [RVT1H470M0607]
C4  22uF  [Cap-0805]
C5  0.1uF  [Cap-0603]
C6  1uF  [Cap-0805]
C7  10uF  [Cap-1210]
C8  4.7uF  [Cap-0402]
C9  1uF  [Cap-0402]
C10  1uF  [Cap-0402]
C11  0.1uF  [Cap-0402]
C12  22uF  [Cap-0805]
C13  22uF  [Cap-0805]
C18  220uF  [189RV0019]
D1  SS510B  [SMB_]
D2  SMBJ26CA  [SMB Bi Directional]
F1  BSMD2920-330-30V  [Fuse-2920]
J1  DC-044K-D025  [DC-044K-D025]
L1  4.7uH  [YPRH0703-4R7M]
U1  AP63205WU-7  [TSOT-23-6]
U2  AMS1117-3.3  [SOT- 223]

### Ports
3V3 (see Top_Sheet[2B], Controller-Sheet[4D]), 5V (see Top_Sheet[2B], Controller-Sheet[4D]), DC_24V (see Top_Sheet[2B], Controller-Sheet[4D]), GND (see Top_Sheet[2B], Controller-Sheet[4D])

### Nets
3V3: C4.2 C10.2 C11.2 U2.2(VOUT) U2.4(VOUT) ; port 3V3
5V: C8.2 C9.2 C12.2 C13.2 L1.2 U1.1(FB) U2.3(VIN) ; port 5V
DC_24V: C2.1 C3.1 C5.1 C6.2 C7.2 C18.1 D2.2(K) F1.2 U1.2(EN) U1.3(VIN) ; port DC_24V
GND: C2.2 C3.2 C4.1 C5.2 C6.1 C7.1 C8.1 C9.1 C10.1 C11.1 C12.1 C13.1 C18.2 D2.1(A) J1.1 J1.2 J1.3 J1.6 U1.4(GND) U2.1(GND) ; port GND
NetC1_1: C1.1 L1.1 U1.5(SW)
NetC1_2: C1.2 U1.6(BST)
NetD1_1: D1.1(A) J1.4
NetD1_2: D1.2(K) F1.1

### Notes on the sheet
- (near J1) DC 24V
- File:
- Title:
- Date:
- Page
- Num:
- Total:
- Drawn By: Huzaifa Ali

### Library data of the parts
C1 C11 = CL05B104KB54PNC: CAP CER 0.1UF 50V X7R 0402; Manufacturer: Samsung; Supplier 1: Digi-Key; Manufacturer Part Number: CL05B104KB54PNC; Stock 1: 8594; Pricing 1: 1=0.1, 10=0.067, 50=0.0366, 100=0.0299, 500=0.02138, 1000=0.01681, 2500=0.01528, 5000=0.01406 (USD); Supplier Part Number 1: 1276-CL05B104KB54PNCDKR-ND; LCSC Part Number: C307331
C2 C3 = RVT1H470M0607: 47uF 50V 66mA@120Hz ±20% SMD,D6.3xL7.7mm Aluminum Electrolytic Capacitors - SMD ROHS; Manufacturer: ROQANG; Manufacturer Part Number: RVT1H470M0607; Package: SMD,D6.3xL7.7mm; LCSC Part Number: C72523; Item Type: Capacitor; ComponentLink1Description: LCSC; ComponentLink1URL: https://www.lcsc.com/product-detail/Aluminum-Electrolytic-Capacitors-SMD_ROQANG-RVT1H470M0607_C72523.html
C4 C12 C13 = GRM21BR61A226ME44L: CAP CER 22UF 10V X5R 0805; Manufacturer: Murata; Dielectric Material: Ceramic; Tolerance: 20%; Dissipation Factor: 0.035%; Item Type: Capacitor; Supplier 1: Arrow Electronics; Manufacturer Part Number: GRM21BR61A226ME44L; RoHS: Yes; Category: Ceramic Capacitors; Stock 1: 3000; Pricing 1: 3000=0.08250, 6000=0.06070, 9000=0.06010, 15000=0.05960 (USD); Mounting Technology: Surface Mount; Case/Package: 0805; Case Code (Metric): 2012; Case Code (Imperial): 0805; Weight: 0.000335oz; Min Operating Temperature: -55°C; Max Operating Temperature: 85°C; Value: 22uF; Dielectric: X5R; Voltage Rating (DC): 10V; Packaging: Tape and Reel; Voltage Rating: 10V; Voltage: 10V; Termination: SMD/SMT; Package Quantity: 3000; Series: GRM; Length: 2mm; Width: 0.049inch; Height: 1.25mm; Thickness: 0.057inch; Depth: 1.25mm; Lead Free: Lead Free; RoHS Compliant: Yes; ComponentLink1URL: http://www.mouser.com/ds/2/281/c02e-2905.pdf?src-supplier=Mouser; ComponentLink1Description: http://www.mouser.com/ds/2/281/c02e-2905.pdf?src-supplier=Mouser; ComponentLink2URL: http://search.murata.co.jp/Ceramy/image/img/A01X/G101/ENG/GRM21BR61A226ME44-01.pdf?src-supplier=Digi-Key; ComponentLink2Description: http://search.murata.co.jp/Ceramy/image/img/A01X/G101/ENG/GRM21BR61A226ME44-01.pdf?src-supplier=Digi-Key; ComponentLink3URL: http://search.murata.co.jp/Ceramy/image/img/A01X/partnumbering_e_01.pdf?src-supplier=Digi-Key; ComponentLink3Description: http://search.murata.co.jp/Ceramy/image/img/A01X/partnumbering_e_01.pdf?src-supplier=Digi-Key; Supplier Part Number 1: GRM21BR61A226ME44L; LCSC Part Number: C441864
C5 = CC0603JRX7R9BB104: CAP CER 0.1UF 50V X7R 0603; Manufacturer: Yageo; Item Type: Capacitors; Material: 4241ConductorMaterial; Supplier: Future Electronics; LCSC Part Number: C91183; Manufacturer Part Number: CC0603JRX7R9BB104; RoHS: Yes; Stock: 204000; Pricing: 4000=0.0077, 16000=0.0073, 60000=0.007, 160000=0.0068, 400000=0.0064 (USD); Pins: 2NUMBER; Lead Free: 5697LeadFree; Halogen Free: 5694HalogenFree; ComponentLink1URL: https://datasheet.ciiva.com/11465/upy-gphc-x7r-6-3v-to-50v-8-11465038.pdf?src-supplier=Avnet; ComponentLink1Description: https://datasheet.ciiva.com/11465/upy-gphc-x7r-6-3v-to-50v-8-11465038.pdf?src-supplier=Avnet
C6 = GCM21BC72A105KE36L: CAP CER 1UF 100V X7S 0805; Manufacturer: Murata; Tolerance: 10%; Supplier 1: Digi-Key; Manufacturer Part Number: GCM21BC72A105KE36L; RoHS: Yes; Category: Ceramic Capacitors; Stock 1: 179138; Pricing 1: 1=0.48000, 10=0.34100, 50=0.25800, 100=0.22480, 500=0.16650, 1000=0.14152 (USD); Mount: Surface Mount; Case/Package: 0805; Case Code (Imperial): 0805; Case Code (Metric): 2012; Min Operating Temperature: -55°C; Max Operating Temperature: 125°C; Packaging: Cut Tape; Capacitance: 1uF; Voltage Rating: 100V; Ratings: AEC-Q200; RoHS Compliant: Yes; ComponentLink1URL: http://search.murata.co.jp/Ceramy/image/img/A01X/partnumbering_e_02.pdf?src-supplier=Digi-Key; ComponentLink1Description: http://search.murata.co.jp/Ceramy/image/img/A01X/partnumbering_e_02.pdf?src-supplier=Digi-Key; Supplier Part Number 1: 490-14436-1-ND; LCSC Part Number: C2842838
C7 = GRM32ER71J106KA12L: Multilayer Ceramic Capacitors MLCC - SMD/SMT 1210 10uF 63volts *Derate Voltage/Temp; Manufacturer: Murata; Supplier: Avnet; Supplier Part Number: GRM32ER71J106KA12L; Manufacturer Part Number: GRM32ER71J106KA12L; RoHS: Yes; Category: Ceramic Capacitors; Stock: 55000; Pricing: 1000=0.3451, 2000=0.33698, 4000=0.32886, 6000=0.32074, 8000=0.31262 (USD); ComponentLink1URL: http://www.mouser.com/ds/2/281/c02e-2905.pdf?src-supplier=Mouser; ComponentLink1Description: http://www.mouser.com/ds/2/281/c02e-2905.pdf?src-supplier=Mouser; ComponentLink2URL: http://www.farnell.com/datasheets/2079202.pdf?src-supplier=Farnell; ComponentLink2Description: http://www.farnell.com/datasheets/2079202.pdf?src-supplier=Farnell; ComponentLink3URL: http://search.murata.co.jp/Ceramy/image/img/A01X/G101/ENG/GRM32ER71J106KA12-01.pdf?src-supplier=Digi-Key; ComponentLink3Description: http://search.murata.co.jp/Ceramy/image/img/A01X/G101/ENG/GRM32ER71J106KA12-01.pdf?src-supplier=Digi-Key; ComponentLink4URL: https://datasheet.octopart.com/GRM32ER71J106KA12L-Murata-datasheet-22122223.pdf?src-supplier=Future+Electronics; ComponentLink4Description: https://datasheet.octopart.com/GRM32ER71J106KA12L-Murata-datasheet-22122223.pdf?src-supplier=Future+Electronics; ComponentLink5URL: http://psearch.en.murata.com/capacitor/product/GRM32ER71J106KA12%23.pdf?src-supplier=Avnet; ComponentLink5Description: http://psearch.en.murata.com/capacitor/product/GRM32ER71J106KA12%23.pdf?src-supplier=Avnet; ComponentLink6URL: http://www.farnell.com/datasheets/2079202.pdf?src-supplier=Newark; ComponentLink6Description: http://www.farnell.com/datasheets/2079202.pdf?src-supplier=Newark; ComponentLink7URL: http://www.farnell.com/datasheets/2079202.pdf?src-supplier=Element14; ComponentLink7Description: http://www.farnell.com/datasheets/2079202.pdf?src-supplier=Element14; Package: 1210; LCSC Part Number: C437568; Item Type: Capacitor; ComponentLink8Description: LCSC; ComponentLink8URL: https://www.lcsc.com/product-detail/Multilayer-Ceramic-Capacitors-MLCC-SMD-SMT_Murata-Electronics-GRM32ER71J106KA12L_C437568.html
C8 = CC0402KRX5R6BB475: CAP CER 4.7UF 10V X5R 0402; Manufacturer: Yageo; Tolerance: 10%; Supplier 1: Farnell; Manufacturer Part Number: CC0402KRX5R6BB475; RoHS: Yes; Category: Ceramic Capacitors; Stock 1: 20000; Pricing 1: 10000=0.02310, 50000=0.02100 (GBP); Mount: Surface Mount; Case/Package: 0402; Case Code (Imperial): 0402; Case Code (Metric): 1005; Min Operating Temperature: -55°C; Max Operating Temperature: 85°C; Packaging: Cut Tape; Capacitance: 4.7uF; Voltage Rating: 10V; RoHS Compliant: Yes; ComponentLink1URL: http://www.yageo.com/documents/recent/UPY-GPHC_X5R_4V-to-50V_25.pdf?src-supplier=Digi-Key; ComponentLink1Description: http://www.yageo.com/documents/recent/UPY-GPHC_X5R_4V-to-50V_25.pdf?src-supplier=Digi-Key; Supplier Part Number 1: 3871698; LCSC Part Number: C326586
C9 C10 = CC0402KRX5R7BB105: as C16 on sheet Controller-Sheet; Supplier 1: Digi-Key; Manufacturer Part Number: CC0402KRX5R7BB105; Stock 1: 1405667; Pricing 1: 1=0.36, 10=0.252, 100=0.1512, 500=0.1134, 1000=0.09576, 2500=0.09072, 5000=0.08568 (USD); Mount: Surface Mount; Case/Package: 0402; Weight: 2.3E-05oz; Case Code (Imperial): 0402; Case Code (Metric): 1005; Min Operating Temperature: -55°C; Max Operating Temperature: 85°C; Capacitance: 1uF; Dielectric: X5R; Packaging: Tape and Reel; Voltage Rating (DC): 16V; Voltage Rating: 16V; Termination: SMD/SMT; Composition: Ceramic; Length: 1mm; Height: 0.5mm; Width: 0.02inch; Thickness: 0.022inch; Depth: 0.5mm; Radiation Hardening: No; Lead Free: Lead Free; Halogen Free: Halogen Free; ComponentLink1URL: http://www.yageo.com/documents/recent/UPY-GPHC_X5R_4V-to-50V_12.pdf?src-supplier=Avnet+Europe; ComponentLink1Description: http://www.yageo.com/documents/recent/UPY-GPHC_X5R_4V-to-50V_12.pdf?src-supplier=Avnet+Europe; Supplier Part Number 1: 311-1691-6-ND; LCSC Part Number: C325464
C18 = 189RV0019: as C14 on sheet Controller-Sheet; Manufacturer Part Number: 189RV0019; Package: SMD,D6.3xL7.7mm; LCSC Part Number: C7471881; Item Type: Capacitors; ComponentLink1Description: LCSC; ComponentLink1URL: https://www.lcsc.com/product-detail/Aluminum-Electrolytic-Capacitors-SMD_KNSCHA-189RV0019_C7471881.html
D1 = SS510B: SCHOTTKY DIODE SMB 100V 5A; Manufacturer: MDD; Manufacturer Part Number: SS510B; Package: SMB; ComponentLink1Description: LCSC; ComponentLink1URL: https://www.lcsc.com/product-detail/Schottky-Barrier-Diodes-SBD_JUXING-SS510B_C3011128.html; LCSC Part Number: C3011128; Item Type: Diode
D2 = SMBJ26CA: SMB(DO-214AA) TVS ROHS; Manufacturer: MSKSEMI; Item Type: Diode; Manufacturer Part Number: SMBJ26CA; Package: SMB(DO-214AA); LCSC Part Number: C5331111; ComponentLink1Description: LCSC; ComponentLink1URL: https://www.lcsc.com/product-detail/TVS_MSKSEMI-SMBJ26CA_C5331111.html
F1 = BSMD2920-330-30V: 30V 3.3A 40A 6.6A 2920 Resettable Fuses ROHS; Manufacturer: BHFUSE; Item Type: Fuse; Supplier: LCSC; LCSC Part Number: C22368176; Manufacturer Part Number: BSMD2920-330-30V; RoHS: No; ComponentLink1Description: LCSC; ComponentLink1URL: https://www.lcsc.com/product-detail/Resettable-Fuses_BHFUSE-BSMD2920-330-30V_C22368176.html
J1 = DC-044K-D025: Bend insert DC Power Receptacle -30℃~+85℃ 2.5mm 6mm 7A 24V Plugin DC Power Connectors ROHS; Manufacturer: G-Switch; Manufacturer Part Number: DC-044K-D025; Package: Plugin; LCSC Part Number: C963204; Item Type: DC Power Connectors; ComponentLink1Description: LCSC; ComponentLink1URL: https://www.lcsc.com/product-detail/DC-Power-Connectors_G-Switch-DC-044K-D025_C963204.html
L1 = YPRH0703-4R7M: 2.26A 4.7uH ±20% SMD,7.3x7.3mm Power Inductors ROHS; Manufacturer: YJYCOIN; Manufacturer Part Number: YPRH0703-4R7M; Package: SMD,7.3x7.3mm; LCSC Part Number: C338836; Item type: Inductor; ComponentLink1Description: LCSC; ComponentLink1URL: https://www.lcsc.com/product-detail/Power-Inductors_YJYCOIN-YPRH0703-4R7M_C338836.html
U1 = AP63205WU-7: IC REG BUCK 5V 2A TSOT26; Manufacturer: Diodes; Supplier 1: Digi-Key; Manufacturer Part Number: AP63205WU-7; RoHS: Yes; Category: Voltage Regulators - Switching; Stock 1: 88525; Pricing 1: 1=0.88, 10=0.776, 25=0.7292, 100=0.5952, 250=0.55284, 500=0.4705, 1000=0.3764 (USD); Supplier Part Number 1: AP63205WU-7DICT-ND; LCSC Part Number: C2071056; Item Type: IC
U2 = AMS1117-3.3: SOT-223 Linear Voltage Regulators (LDO) ROHS; Manufacturer: GUOXIN JIAPIN SEMICONDUCTOR; Item Type: IC; Manufacturer Part Number: AMS1117-3.3; Package: SOT-223; LCSC Part Number: C2992570; ComponentLink1Description: LCSC; ComponentLink1URL: https://www.lcsc.com/product-detail/Linear-Voltage-Regulators-LDO_GUOXIN-JIAPIN-SEMICONDUCTOR-AMS1117-3-3_C2992570.html

## Nets that join several sheets
3V3: Controller-Sheet (C16.2 C17.2 U3.8), Power-Sheet (5 pins)
5V: Controller-Sheet (15 pins), Power-Sheet (7 pins)
DC_24V: Controller-Sheet (C14.1 C15.1 J4.1), Power-Sheet (10 pins)
GND: Controller-Sheet (33 pins), Power-Sheet (20 pins)